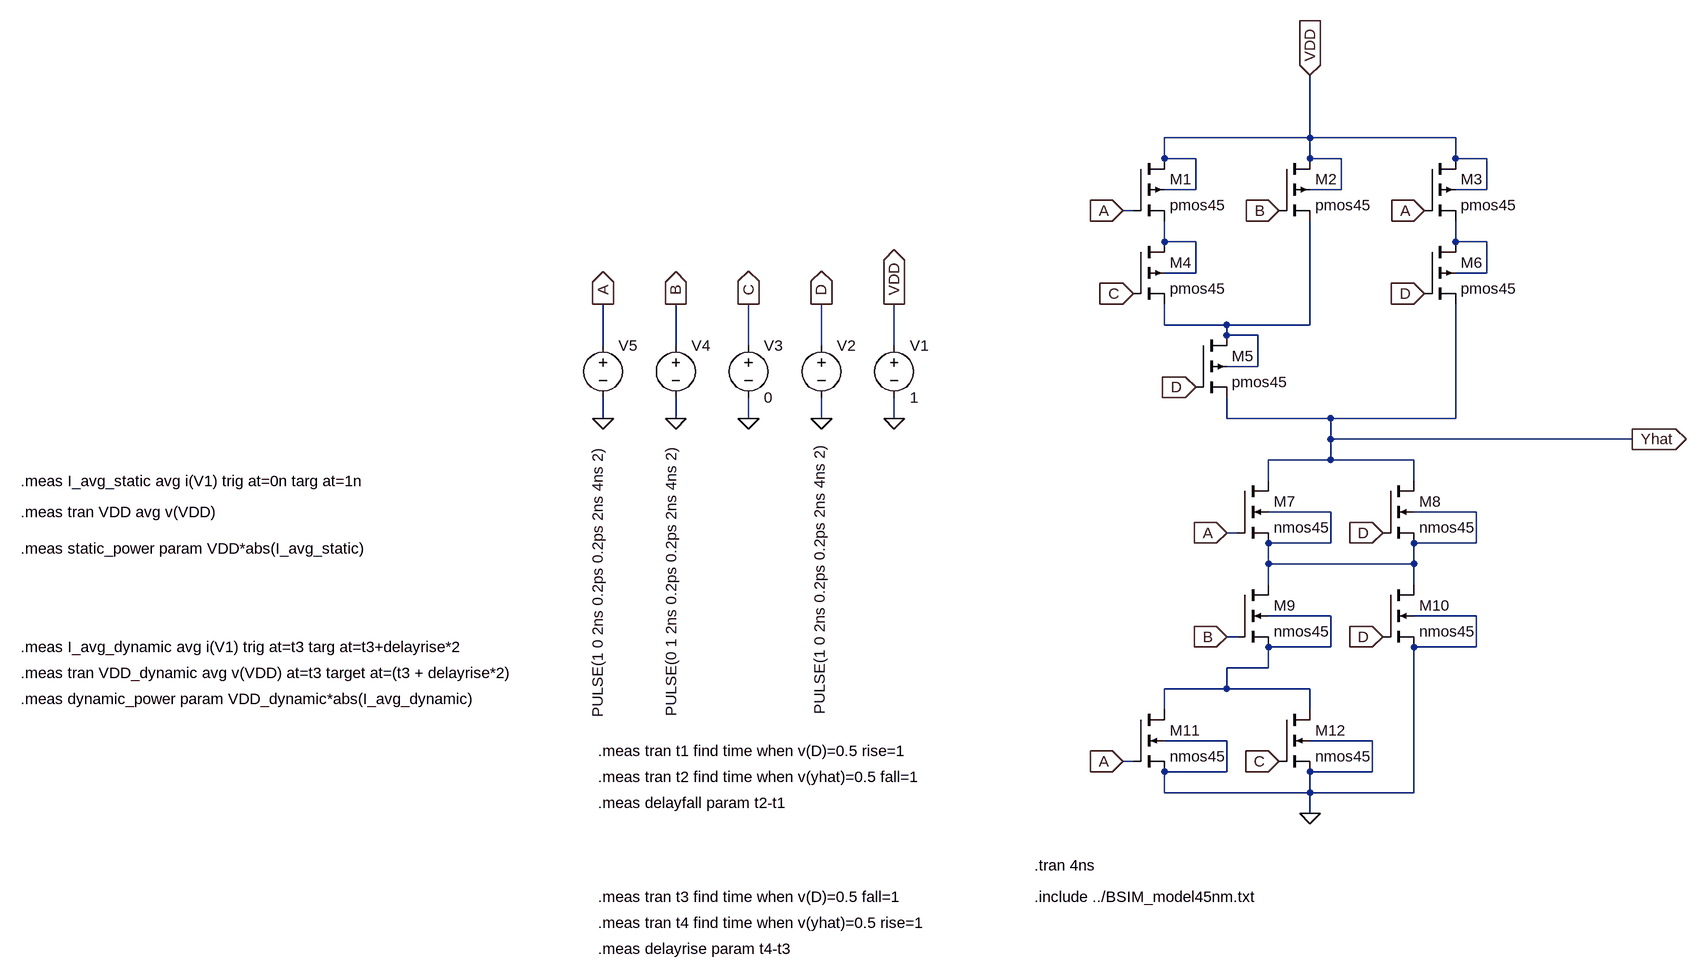
[diagram p0: schematic Kredsloeb eksamen 2022.asc]
Kredsloeb eksamen 2022.asc, the LTspice schematic file:
Version 4
SHEET 1 880 1344
WIRE 288 80 288 -16
WIRE 288 80 64 80
WIRE 512 80 288 80
WIRE 64 112 64 80
WIRE 112 112 64 112
WIRE 288 112 288 80
WIRE 336 112 288 112
WIRE 512 112 512 80
WIRE 560 112 512 112
WIRE 112 160 112 112
WIRE 112 160 64 160
WIRE 336 160 336 112
WIRE 336 160 288 160
WIRE 560 160 560 112
WIRE 560 160 512 160
WIRE 16 192 0 192
WIRE 64 240 64 208
WIRE 112 240 64 240
WIRE 512 240 512 208
WIRE 560 240 512 240
WIRE 112 288 112 240
WIRE 112 288 64 288
WIRE 560 288 560 240
WIRE 560 288 512 288
WIRE 64 368 64 336
WIRE 160 368 64 368
WIRE 288 368 288 208
WIRE 288 368 160 368
WIRE 160 384 160 368
WIRE 208 384 160 384
WIRE -800 400 -800 336
WIRE -688 400 -688 336
WIRE -576 400 -576 336
WIRE -464 400 -464 336
WIRE -352 400 -352 336
WIRE 208 432 208 384
WIRE 208 432 160 432
WIRE -800 512 -800 480
WIRE -688 512 -688 480
WIRE -576 512 -576 480
WIRE -464 512 -464 480
WIRE -352 512 -352 480
WIRE 160 512 160 480
WIRE 320 512 160 512
WIRE 512 512 512 336
WIRE 512 512 320 512
WIRE 320 544 320 512
WIRE 784 544 320 544
WIRE 320 576 320 544
WIRE 320 576 224 576
WIRE 448 576 320 576
WIRE 224 608 224 576
WIRE 448 608 448 576
WIRE 320 656 224 656
WIRE 544 656 448 656
WIRE 176 688 160 688
WIRE 320 704 320 656
WIRE 320 704 224 704
WIRE 544 704 544 656
WIRE 544 704 448 704
WIRE 224 736 224 704
WIRE 448 736 448 704
WIRE 448 736 224 736
WIRE 224 768 224 736
WIRE 448 768 448 736
WIRE 320 816 224 816
WIRE 544 816 448 816
WIRE 176 848 160 848
WIRE 320 864 320 816
WIRE 320 864 224 864
WIRE 544 864 544 816
WIRE 544 864 448 864
WIRE 224 896 224 864
WIRE 224 896 160 896
WIRE 160 928 160 896
WIRE 160 928 64 928
WIRE 288 928 160 928
WIRE 64 960 64 928
WIRE 288 960 288 928
WIRE 160 1008 64 1008
WIRE 384 1008 288 1008
WIRE 16 1040 0 1040
WIRE 160 1056 160 1008
WIRE 160 1056 64 1056
WIRE 384 1056 384 1008
WIRE 384 1056 288 1056
WIRE 64 1088 64 1056
WIRE 288 1088 288 1056
WIRE 288 1088 64 1088
WIRE 448 1088 448 864
WIRE 448 1088 288 1088
WIRE 288 1120 288 1088
FLAG 0 192 A
IOPIN 0 192 In
FLAG 464 192 A
IOPIN 464 192 In
FLAG 240 192 B
IOPIN 240 192 In
FLAG 16 320 C
IOPIN 16 320 In
FLAG 112 464 D
IOPIN 112 464 In
FLAG 464 320 D
IOPIN 464 320 In
FLAG 160 688 A
IOPIN 160 688 In
FLAG 400 688 D
IOPIN 400 688 In
FLAG 160 848 B
IOPIN 160 848 In
FLAG 400 848 D
IOPIN 400 848 In
FLAG 0 1040 A
IOPIN 0 1040 In
FLAG 240 1040 C
IOPIN 240 1040 In
FLAG 288 1120 0
FLAG 288 -16 VDD
IOPIN 288 -16 In
FLAG -352 512 0
FLAG -352 336 VDD
IOPIN -352 336 Out
FLAG -464 512 0
FLAG -464 336 D
IOPIN -464 336 Out
FLAG -576 512 0
FLAG -576 336 C
IOPIN -576 336 Out
FLAG -688 512 0
FLAG -688 336 B
IOPIN -688 336 Out
FLAG -800 512 0
FLAG -800 336 A
IOPIN -800 336 Out
FLAG 784 544 Yhat
IOPIN 784 544 Out
SYMBOL pmos4 16 112 R0
SYMATTR InstName M1
SYMATTR Value pmos45
SYMATTR Value2 l=60nm w=800nm
SYMBOL pmos4 240 112 R0
SYMATTR InstName M2
SYMATTR Value pmos45
SYMATTR Value2 l=60nm w=800nm
SYMBOL pmos4 464 112 R0
SYMATTR InstName M3
SYMATTR Value pmos45
SYMATTR Value2 l=60nm w=800nm
SYMBOL pmos4 16 240 R0
SYMATTR InstName M4
SYMATTR Value pmos45
SYMATTR Value2 l=60nm w=400nm
SYMBOL pmos4 112 384 R0
SYMATTR InstName M5
SYMATTR Value pmos45
SYMATTR Value2 l=60nm w=800nm
SYMBOL pmos4 464 240 R0
SYMATTR InstName M6
SYMATTR Value pmos45
SYMATTR Value2 l=60nm w=800nm
SYMBOL nmos4 176 608 R0
SYMATTR InstName M7
SYMATTR Value nmos45
SYMATTR Value2 l=60nm w=600nm
SYMBOL nmos4 400 608 R0
SYMATTR InstName M8
SYMATTR Value nmos45
SYMATTR Value2 l=60nm w=400nm
SYMBOL nmos4 176 768 R0
SYMATTR InstName M9
SYMATTR Value nmos45
SYMATTR Value2 l=60nm w=600nm
SYMBOL nmos4 400 768 R0
SYMATTR InstName M10
SYMATTR Value nmos45
SYMATTR Value2 l=60nm w=400nm
SYMBOL nmos4 16 960 R0
SYMATTR InstName M11
SYMATTR Value nmos45
SYMATTR Value2 l=60nm w=600nm
SYMBOL nmos4 240 960 R0
SYMATTR InstName M12
SYMATTR Value nmos45
SYMATTR Value2 l=60nm w=600nm
SYMBOL Voltage -352 384 R0
SYMATTR InstName V1
SYMATTR Value 1
SYMBOL Voltage -464 384 R0
WINDOW 3 -3 584 VLeft 2
SYMATTR InstName V2
SYMATTR Value PULSE(1 0 2ns 0.2ps 0.2ps 2ns 4ns 2)
SYMBOL Voltage -576 384 R0
SYMATTR InstName V3
SYMATTR Value 0
SYMBOL Voltage -688 384 R0
WINDOW 3 -7 587 VLeft 2
SYMATTR InstName V4
SYMATTR Value PULSE(0 1 2ns 0.2ps 0.2ps 2ns 4ns 2)
SYMBOL Voltage -800 384 R0
WINDOW 3 -8 588 VLeft 2
SYMATTR InstName V5
SYMATTR Value PULSE(1 0 2ns 0.2ps 0.2ps 2ns 4ns 2)
TEXT -136 1200 Left 2 !.tran 4ns
TEXT -136 1248 Left 2 !.include ../BSIM_model45nm.txt
TEXT -808 1024 Left 2 !.meas tran t1 find time when v(D)=0.5 rise=1
TEXT -808 1064 Left 2 !.meas tran t2 find time when v(yhat)=0.5 fall=1
TEXT -808 1104 Left 2 !.meas delayfall param t2-t1
TEXT -808 1248 Left 2 !.meas tran t3 find time when v(D)=0.5 fall=1
TEXT -808 1288 Left 2 !.meas tran t4 find time when v(yhat)=0.5 rise=1
TEXT -808 1328 Left 2 !.meas delayrise param t4-t3
TEXT -1696 608 Left 2 !.meas I_avg_static avg i(V1) trig at=0n targ at=1n
TEXT -1696 656 Left 2 !.meas tran VDD avg v(VDD)
TEXT -1696 712 Left 2 !.meas static_power param VDD*abs(I_avg_static)
TEXT -1696 864 Left 2 !.meas I_avg_dynamic avg i(V1) trig at=t3 targ at=t3+delayrise*2
TEXT -1696 904 Left 2 !.meas tran VDD_dynamic avg v(VDD) at=t3 target at=(t3 + delayrise*2)
TEXT -1696 944 Left 2 !.meas dynamic_power param VDD_dynamic*abs(I_avg_dynamic)

The netlist it stands for:
* Kredsloeb eksamen 2022.asc
M1 VDD A N001 VDD pmos45 l=60nm w=800nm
M2 VDD B N003 VDD pmos45 l=60nm w=800nm
M3 VDD A N002 VDD pmos45 l=60nm w=800nm
M4 N001 C N003 N001 pmos45 l=60nm w=400nm
M5 N003 D Yhat N003 pmos45 l=60nm w=800nm
M6 N002 D Yhat N002 pmos45 l=60nm w=800nm
M7 Yhat A N004 N004 nmos45 l=60nm w=600nm
M8 Yhat D N004 N004 nmos45 l=60nm w=400nm
M9 N004 B N005 N005 nmos45 l=60nm w=600nm
M10 N004 D 0 0 nmos45 l=60nm w=400nm
M11 N005 A 0 0 nmos45 l=60nm w=600nm
M12 N005 C 0 0 nmos45 l=60nm w=600nm
V1 VDD 0 1
V2 D 0 PULSE(1 0 2ns 0.2ps 0.2ps 2ns 4ns 2)
V3 C 0 0
V4 B 0 PULSE(0 1 2ns 0.2ps 0.2ps 2ns 4ns 2)
V5 A 0 PULSE(1 0 2ns 0.2ps 0.2ps 2ns 4ns 2)
.model NMOS NMOS
.model PMOS PMOS
.lib standard.mos
.tran 4ns
.include ../BSIM_model45nm.txt
.meas tran t1 find time when v(D)=0.5 rise=1
.meas tran t2 find time when v(yhat)=0.5 fall=1
.meas delayfall param t2-t1
.meas tran t3 find time when v(D)=0.5 fall=1
.meas tran t4 find time when v(yhat)=0.5 rise=1
.meas delayrise param t4-t3
.meas I_avg_static avg i(V1) trig at=0n targ at=1n
.meas tran VDD avg v(VDD)
.meas static_power param VDD*abs(I_avg_static)
.meas I_avg_dynamic avg i(V1) trig at=t3 targ at=t3+delayrise*2
.meas tran VDD_dynamic avg v(VDD) at=t3 target at=(t3 + delayrise*2)
.meas dynamic_power param VDD_dynamic*abs(I_avg_dynamic)
.backanno
.end